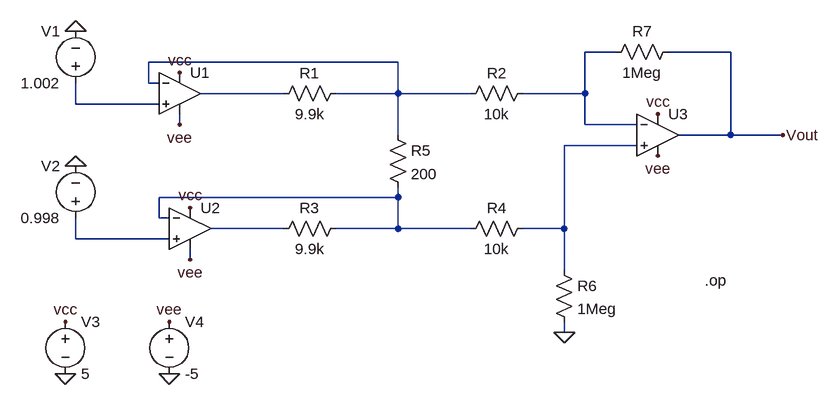
[diagram p0: schematic instrumentation_amplifier.asc]
instrumentation_amplifier.asc, the LTspice schematic file:
Version 4.1
SHEET 1 880 680
WIRE 432 -48 384 -48
WIRE 608 -48 512 -48
WIRE 96 -32 -288 -32
WIRE -288 0 -288 -32
WIRE -272 0 -288 0
WIRE -80 16 -208 16
WIRE 96 16 96 -32
WIRE 96 16 0 16
WIRE 208 16 96 16
WIRE 384 16 384 -48
WIRE 384 16 288 16
WIRE -400 32 -400 0
WIRE -272 32 -400 32
WIRE -240 64 -240 48
WIRE 384 64 384 16
WIRE 464 64 384 64
WIRE 96 80 96 16
WIRE 608 80 608 -48
WIRE 608 80 528 80
WIRE 688 80 608 80
WIRE 464 96 352 96
WIRE 96 176 96 160
WIRE 96 176 -272 176
WIRE -272 208 -272 176
WIRE -256 208 -272 208
WIRE -80 224 -192 224
WIRE 96 224 96 176
WIRE 96 224 0 224
WIRE 208 224 96 224
WIRE 352 224 352 96
WIRE 352 224 288 224
WIRE -400 240 -400 208
WIRE -256 240 -400 240
WIRE -224 272 -224 256
WIRE 352 288 352 224
WIRE 352 384 352 368
FLAG -400 -80 0
FLAG -400 128 0
FLAG -416 368 vcc
FLAG -416 448 0
FLAG -256 448 0
FLAG -256 368 vee
FLAG 352 384 0
FLAG 688 80 Vout
FLAG 496 48 vcc
FLAG 496 112 vee
FLAG -240 64 vee
FLAG -224 272 vee
FLAG -224 192 vcc
FLAG -240 -16 vcc
SYMBOL voltage -400 16 R180
WINDOW 0 24 96 Left 2
WINDOW 3 24 16 Left 2
SYMATTR InstName V1
SYMATTR Value 1.002
SYMBOL voltage -400 224 R180
WINDOW 0 24 96 Left 2
WINDOW 3 24 16 Left 2
SYMATTR InstName V2
SYMATTR Value 0.998
SYMBOL OpAmps\\UniversalOpAmp2 -240 16 R0
SYMATTR InstName U1
SYMBOL OpAmps\\UniversalOpAmp2 -224 224 R0
SYMATTR InstName U2
SYMBOL voltage -416 352 R0
WINDOW 123 0 0 Left 0
WINDOW 39 0 0 Left 0
SYMATTR InstName V3
SYMATTR Value 5
SYMBOL voltage -256 352 R0
WINDOW 123 0 0 Left 0
WINDOW 39 0 0 Left 0
SYMATTR InstName V4
SYMATTR Value -5
SYMBOL res 16 0 R90
WINDOW 0 0 56 VBottom 2
WINDOW 3 32 56 VTop 2
SYMATTR InstName R1
SYMATTR Value 9.9k
SYMBOL res 304 0 R90
WINDOW 0 0 56 VBottom 2
WINDOW 3 32 56 VTop 2
SYMATTR InstName R2
SYMATTR Value 10k
SYMBOL res 16 208 R90
WINDOW 0 0 56 VBottom 2
WINDOW 3 32 56 VTop 2
SYMATTR InstName R3
SYMATTR Value 9.9k
SYMBOL res 304 208 R90
WINDOW 0 0 56 VBottom 2
WINDOW 3 32 56 VTop 2
SYMATTR InstName R4
SYMATTR Value 10k
SYMBOL res 80 64 R0
SYMATTR InstName R5
SYMATTR Value 200
SYMBOL res 336 272 R0
SYMATTR InstName R6
SYMATTR Value 1Meg
SYMBOL res 416 -32 R270
WINDOW 0 32 56 VTop 2
WINDOW 3 0 56 VBottom 2
SYMATTR InstName R7
SYMATTR Value 1Meg
SYMBOL OpAmps\\UniversalOpAmp2 496 80 R0
SYMATTR InstName U3
TEXT 568 304 Left 2 !.op

The netlist it stands for:
* instrumentation_amplifier.asc
V1 N004 0 1.002
V2 N008 0 0.998
X§U1 N004 N002 vcc vee N003 level2 Avol=1Meg GBW=10Meg Slew=10Meg Ilimit=25m Rail=0 Vos=0 En=0 Enk=0 In=0 Ink=0 Rin=500Meg  ; pins In+ In- V+ V- OUT
X§U2 N008 N006 vcc vee N007 level2 Avol=1Meg GBW=10Meg Slew=10Meg Ilimit=25m Rail=0 Vos=0 En=0 Enk=0 In=0 Ink=0 Rin=500Meg  ; pins In+ In- V+ V- OUT
V3 vcc 0 5
V4 vee 0 -5
R1 N002 N003 9.9k
R2 N001 N002 10k
R3 N006 N007 9.9k
R4 N005 N006 10k
R5 N002 N006 200
R6 N005 0 1Meg
R7 N001 Vout 1Meg
X§U3 N005 N001 vcc vee Vout level2 Avol=1Meg GBW=10Meg Slew=10Meg Ilimit=25m Rail=0 Vos=0 En=0 Enk=0 In=0 Ink=0 Rin=500Meg  ; pins In+ In- V+ V- OUT
.op
.lib UniversalOpAmp2.lib
.backanno
.end